# Altium schematic sheet S5_Gps_Telem_Ports.SchDoc
size 420 x 297 mm; SheetNumber: 5; SheetTotal: 9
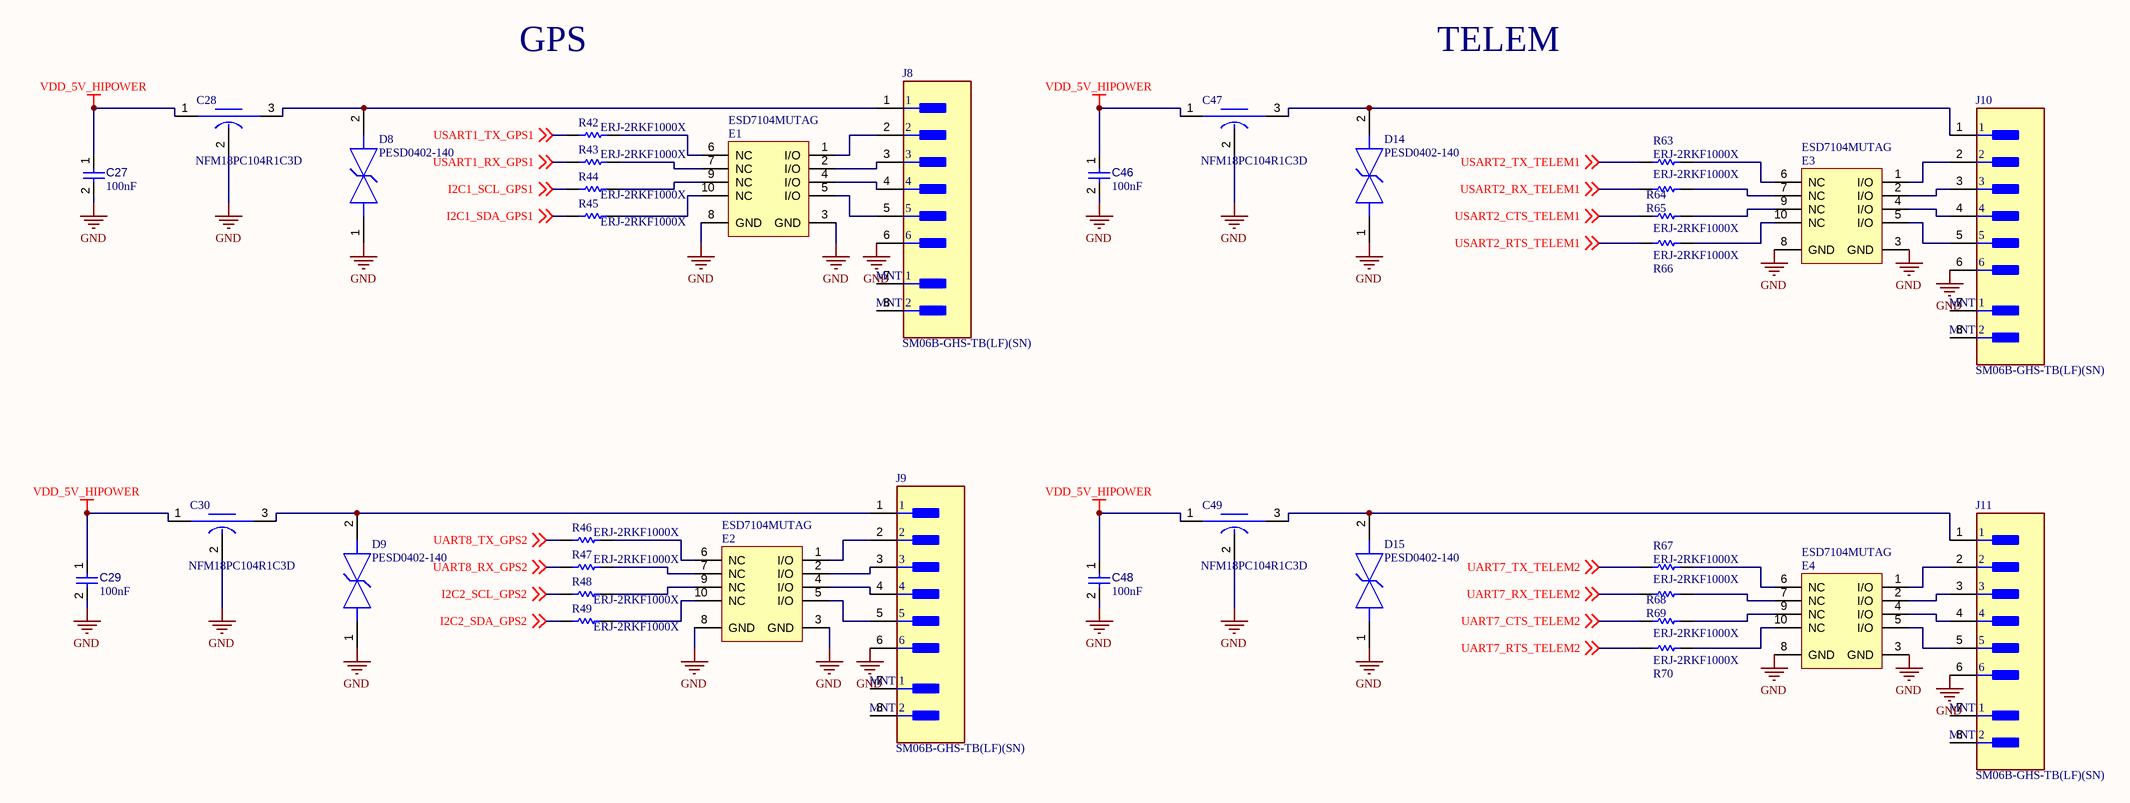
[diagram p0: S5_Gps_Telem_Ports.SchDoc]

## Parts
C27  value 100nF  [CAPC0402(1005)60_L]  (hidden comment: Capacitor 100nF +/-20% 25V 0402)
C28  NFM18PC104R1C3D  [FP-NFM18-0_1-e0_15_0_35-MFG]
C29  value 100nF  [CAPC0402(1005)60_L]  (hidden comment: Capacitor 100nF +/-20% 25V 0402)
C30  NFM18PC104R1C3D  [FP-NFM18-0_1-e0_15_0_35-MFG]
C46  value 100nF  [CAPC0402(1005)60_L]  (hidden comment: Capacitor 100nF +/-20% 25V 0402)
C47  NFM18PC104R1C3D  [FP-NFM18-0_1-e0_15_0_35-MFG]
C48  value 100nF  [CAPC0402(1005)60_L]  (hidden comment: Capacitor 100nF +/-20% 25V 0402)
C49  NFM18PC104R1C3D  [FP-NFM18-0_1-e0_15_0_35-MFG]
D8  PESD0402-140  [FP-PESD0402-MFG]
D9  PESD0402-140  [FP-PESD0402-MFG]
D14  PESD0402-140  [FP-PESD0402-MFG]
D15  PESD0402-140  [FP-PESD0402-MFG]
E1  ESD7104MUTAG  [ONSC-UDFN-10-517BB-01_V]
E2  ESD7104MUTAG  [ONSC-UDFN-10-517BB-01_V]
E3  ESD7104MUTAG  [ONSC-UDFN-10-517BB-01_V]
E4  ESD7104MUTAG  [ONSC-UDFN-10-517BB-01_V]
J8  SM06B-GHS-TB(LF)(SN)  [FP-SM06B-GHS-TB_LF_SN-MFG]
J9  SM06B-GHS-TB(LF)(SN)  [FP-SM06B-GHS-TB_LF_SN-MFG]
J10  SM06B-GHS-TB(LF)(SN)  [FP-SM06B-GHS-TB_LF_SN-MFG]
J11  SM06B-GHS-TB(LF)(SN)  [FP-SM06B-GHS-TB_LF_SN-MFG]
R42  ERJ-2RKF1000X  [RESC1005X40X25LL05T05]
R43  ERJ-2RKF1000X  [RESC1005X40X25LL05T05]
R44  ERJ-2RKF1000X  [RESC1005X40X25LL05T05]
R45  ERJ-2RKF1000X  [RESC1005X40X25LL05T05]
R46  ERJ-2RKF1000X  [RESC1005X40X25LL05T05]
R47  ERJ-2RKF1000X  [RESC1005X40X25LL05T05]
R48  ERJ-2RKF1000X  [RESC1005X40X25LL05T05]
R49  ERJ-2RKF1000X  [RESC1005X40X25LL05T05]
R63  ERJ-2RKF1000X  [RESC1005X40X25LL05T05]
R64  ERJ-2RKF1000X  [RESC1005X40X25LL05T05]
R65  ERJ-2RKF1000X  [RESC1005X40X25LL05T05]
R66  ERJ-2RKF1000X  [RESC1005X40X25LL05T05]
R67  ERJ-2RKF1000X  [RESC1005X40X25LL05T05]
R68  ERJ-2RKF1000X  [RESC1005X40X25LL05T05]
R69  ERJ-2RKF1000X  [RESC1005X40X25LL05T05]
R70  ERJ-2RKF1000X  [RESC1005X40X25LL05T05]

## Nets
GND: C27.2 C28.2(GND) C29.2 C30.2(GND) C46.2 C47.2(GND) C48.2 C49.2(GND) D8.1 D9.1 D14.1 D15.1 E1.3(GND) E1.8(GND) E2.3(GND) E2.8(GND) E3.3(GND) E3.8(GND) E4.3(GND) E4.8(GND) J8.6 J9.6 J10.6 J11.6
VDD_5V_HIPOWER: C27.1 C28.1(Input) C29.1 C30.1(Input) C46.1 C47.1(Input) C48.1 C49.1(Input)
I2C1_SCL_GPS1: R44.1 ; off-sheet I2C1_SCL_GPS1
I2C1_SDA_GPS1: R45.1 ; off-sheet I2C1_SDA_GPS1
I2C2_SCL_GPS2: R48.1 ; off-sheet I2C2_SCL_GPS2
I2C2_SDA_GPS2: R49.1 ; off-sheet I2C2_SDA_GPS2
UART7_CTS_TELEM2: R69.1 ; off-sheet UART7_CTS_TELEM2
UART7_RTS_TELEM2: R70.1 ; off-sheet UART7_RTS_TELEM2
UART7_RX_TELEM2: R68.1 ; off-sheet UART7_RX_TELEM2
UART7_TX_TELEM2: R67.1 ; off-sheet UART7_TX_TELEM2
UART8_RX_GPS2: R47.1 ; off-sheet UART8_RX_GPS2
UART8_TX_GPS2: R46.1 ; off-sheet UART8_TX_GPS2
USART1_RX_GPS1: R43.1 ; off-sheet USART1_RX_GPS1
USART1_TX_GPS1: R42.1 ; off-sheet USART1_TX_GPS1
USART2_CTS_TELEM1: R65.1 ; off-sheet USART2_CTS_TELEM1
USART2_RTS_TELEM1: R66.1 ; off-sheet USART2_RTS_TELEM1
USART2_RX_TELEM1: R64.1 ; off-sheet USART2_RX_TELEM1
USART2_TX_TELEM1: R63.1 ; off-sheet USART2_TX_TELEM1
NetC28_3: C28.3(Output) D8.2 J8.1
NetC30_3: C30.3(Output) D9.2 J9.1
NetC47_3: C47.3(Output) D14.2 J10.1
NetC49_3: C49.3(Output) D15.2 J11.1
NetE1_1: E1.1(I/O) J8.2
NetE1_2: E1.2(I/O) J8.3
NetE1_4: E1.4(I/O) J8.4
NetE1_5: E1.5(I/O) J8.5
NetE1_6: E1.6(NC) R42.2
NetE1_7: E1.7(NC) R43.2
NetE1_9: E1.9(NC) R44.2
NetE1_10: E1.10(NC) R45.2
NetE2_1: E2.1(I/O) J9.2
NetE2_2: E2.2(I/O) J9.3
NetE2_4: E2.4(I/O) J9.4
NetE2_5: E2.5(I/O) J9.5
NetE2_6: E2.6(NC) R46.2
NetE2_7: E2.7(NC) R47.2
NetE2_9: E2.9(NC) R48.2
NetE2_10: E2.10(NC) R49.2
NetE3_1: E3.1(I/O) J10.2
NetE3_2: E3.2(I/O) J10.3
NetE3_4: E3.4(I/O) J10.4
NetE3_5: E3.5(I/O) J10.5
NetE3_6: E3.6(NC) R63.2
NetE3_7: E3.7(NC) R64.2
NetE3_9: E3.9(NC) R65.2
NetE3_10: E3.10(NC) R66.2
NetE4_1: E4.1(I/O) J11.2
NetE4_2: E4.2(I/O) J11.3
NetE4_4: E4.4(I/O) J11.4
NetE4_5: E4.5(I/O) J11.5
NetE4_6: E4.6(NC) R67.2
NetE4_7: E4.7(NC) R68.2
NetE4_9: E4.9(NC) R69.2
NetE4_10: E4.10(NC) R70.2

Not connected (* = marked no-connect by the designer): J8 7(MNT_1) 8(MNT_2); J9 7(MNT_1) 8(MNT_2); J10 7(MNT_1) 8(MNT_2); J11 7(MNT_1) 8(MNT_2)

## Notes on the sheet
- GPS
- TELEM
- THIS DOCUMENT AND THE DATA DISCLOSED HEREIN OR
- HEREWITH IS THE PROPERTY OF ALTIUM LIMITED AND MAY
- DWG NO:
- REVISION
- REV:
- DESCRIPTION
- DATE
- APPROVED
- BE FREELY DISTRIBUTED IN WHOLE. NO RIGHTS ARE
- RESERVED OR EXPRESS OR IMPLIED WARANTEE GIVEN.
- ENG:
- APPROVALS
- PROJECT
- DSN:
- CHK:
- REFERENCE DOCUMENTS
- PROJECT REVISION:
- TITLE
- DOCUMENT REVISION:
- DESIGN ITEM:
- BOM:
- FAB DWG:
- PCB DWG:
- ASSY DWG:
- SCALE:
- A3
- SIZE
- CAGE CODE
- FILE NAME
- DWG NO.
- SHEET
- OF
- REV

## Library data of the parts
C27 C29 C46 C48 = CMP-001-00065-4: Chip Capacitor, 100nF +/-20%, 25V, 0402, Thickness 0.6 mm; Tolerance: 10%; Max Operating Temperature: 85°C; Min Operating Temperature: -55°C; Pins: 2; Voltage Rating: 25V; Mounting Technology: SMT; Case/Package: 0402
C28 C30 C47 C49 = CMP-06053-000054-1: Large Current 3 Terminals Low ESL Chip Multilayer Ceramic Capacitors for General Purpose, 0603, 0.10uF, 20%, 16V; Capacitance: 100nF; Insulation Resistance: 1GR; Current Rating: 2A; DC Resistance (DCR): 30mR; Case Code (Imperial): 0603; REACH SVHC: No SVHC; Width: 0.8mm; Case Code (Metric): 1608; Voltage Rating (DC): 16V; Case/Package: 0603; Packaging: Tape and Reel; Length: 1.6mm; Height: 0.6mm; Voltage: 16V; Depth: 0.8mm; Radiation Hardening: No; Max Operating Temperature: 125°C; Max Voltage Rating (DC): 16V; Voltage Rating: 16V; Max Current Rating: 2A; Tolerance: 20%; Min Operating Temperature: -55°C; Mount: PCB; Termination: Flat; Current: 2A; Package Quantity: 4000; Lead Free: Lead Free
D8 D9 D14 D15 = CMP-08607-000011-1: TVS DIODE 14V 40V 0402; Manufacturer: Littelfuse Inc.; Automotive Grade: Grade 1; Capacitance: 0.25pF; Value: 0.25pF; Direction: Bidirectional; Number Of Channels: 1; Temperature Range Low: -55°C; Lead Free: Yes; Temperature: -55°C to +125°C; Digikey Description: TVS DIODE 14V 40V 0402; Automotive: Yes; Device Class L2: TVS Diodes; Reverse Standoff Voltage: 14V; Device Class L1: Circuit Protection; Ipc Land Pattern Name: DIOC10050X33; Manufacturer Part Number: PESD0402-140; Breakdown Voltage: 14V; Height: 0.43mm; Clamping Voltage: 40V; RoHS: TRUE; Temperature Range High: +125°C; Device Class L3: unset; Octopart: https://octopart.com/pesd0402-140-littelfuse-74215061; Package: PESD0402; ComponentLink2URL: https://www.littelfuse.com/~/media/electronics/datasheets/polymer_esd_suppressors/littelfuse_polymer_esd_suppressor_pesd_catalog_datasheet.pdf.pdf; Category: Diode; ComponentLink2Description: Datasheet
E1-E4 = CMP-1063-00242-1: Transient Voltage Suppressor, Low Capacitance ESD Protection for High Speed Data, 10-Pin UDFN, Pb-Free, Tape and Reel; Manufacturer: On Semiconductor; IR Max (uA): 1; Number of Lines: 4; VRWM Max (V): 5; Direction: Bidirectional; V(BR) Min (V): 5.5; PackageDescription: 10-Pin Small Outline No-Lead, Body 2.5 x 1 mm, Pitch 0.5 mm; ComponentLink3URL: http://www.onsemi.com/pub_link/Collateral/517BB.PDF; PackageReference: UDFN-10-517BB-01; Mounting Technology: Surface Mount; PartNumber: ESD7104MUTAG; ComponentLink1URL: http://www.onsemi.com/; ComponentLink1Description: Manufacturer URL; DatasheetVersion: Rev. 2; ComponentLink2Description: Datasheet; ComponentLink2URL: http://www.onsemi.cn/pub_link/Collateral/ESD7104-D.PDF; PackageVersion: Rev. O, 11/2009; Packing: Tape and Reel; RoHS: Pb-Free; ComponentLink3Description: Package Specification
J8-J11 = CMP-17439-000061-1: CONN HEADER SMD R/A 6POS 1.25MM; Number of Contacts: 6; Voltage Rating: 50V; Current Rating: 1A; Connector Type: Outer Shroud Contact; Contact Resistance: 50mR; Orientation: Right Angle; Max Operating Temperature: 85°C; Mount: Surface Mount; Packaging: Tape and Reel; Contact Plating: Tin; Depth: 4.05mm; Max Voltage Rating (AC): 50V; Lead Free: Lead Free; Pitch: 1.25mm; Number of Positions: 6; Max Current Rating: 1A; Termination: Solder; Min Operating Temperature: -25°C; Housing Color: Beige; Fastening Type: Ramp; Length: 10.75mm; Color: Natural; Contact Material: Bronze; Housing Material: Polyamide; Number of Rows: 1
R42-R49 R63-R70 = CMP-2002-00605-3: Chip Resistor, 100 Ohm, +/- 1%, 100 mW, -55 to 155 degC, 0402 (1005 Metric), RoHS, Tape and Reel; Manufacturer: Basic Passives; Power Rating: 100 mW; Resistance: 100 Ohm; Voltage Rating: 50 V; Case\/Package: 0402; Width: 0.5 mm; Pins: 2; ComponentLink2Description: Datasheet; PackageReference: 0402; Height: 0.35 mm; Tolerance: 1%; DatasheetVersion: 04/2015; Case Code (Imperial): 0402; Min Operating Temperature: -55 degC; Radiation Hardening: No; Length: 1 mm; Package Quantity: 10000; PackageDescription: 2-Pin Surface Mount Device, Body 1 x 0.5 mm; Mounting Technology: Surface Mount; Case Code (Metric): 1005; Packaging: Tape and Reel; ComponentLink1URL: http://www.panasonic.com/; RoHSCompliant: true; Max Operating Temperature: 155 degC; REACH SVHC: Yes; PartNumber: ERJ-2RKF1000X; ComponentLink1Description: Manufacturer URL; ComponentLink2URL: http://industrial.panasonic.com/cdbs/www-data/pdf/RDA0000/AOA0000C86.pdf; Mount: Surface Mount